# Altium schematic sheet Peripherals-Sheet-2.SchDoc
size 420 x 297 mm; SheetNumber: 10; SheetTotal: 12
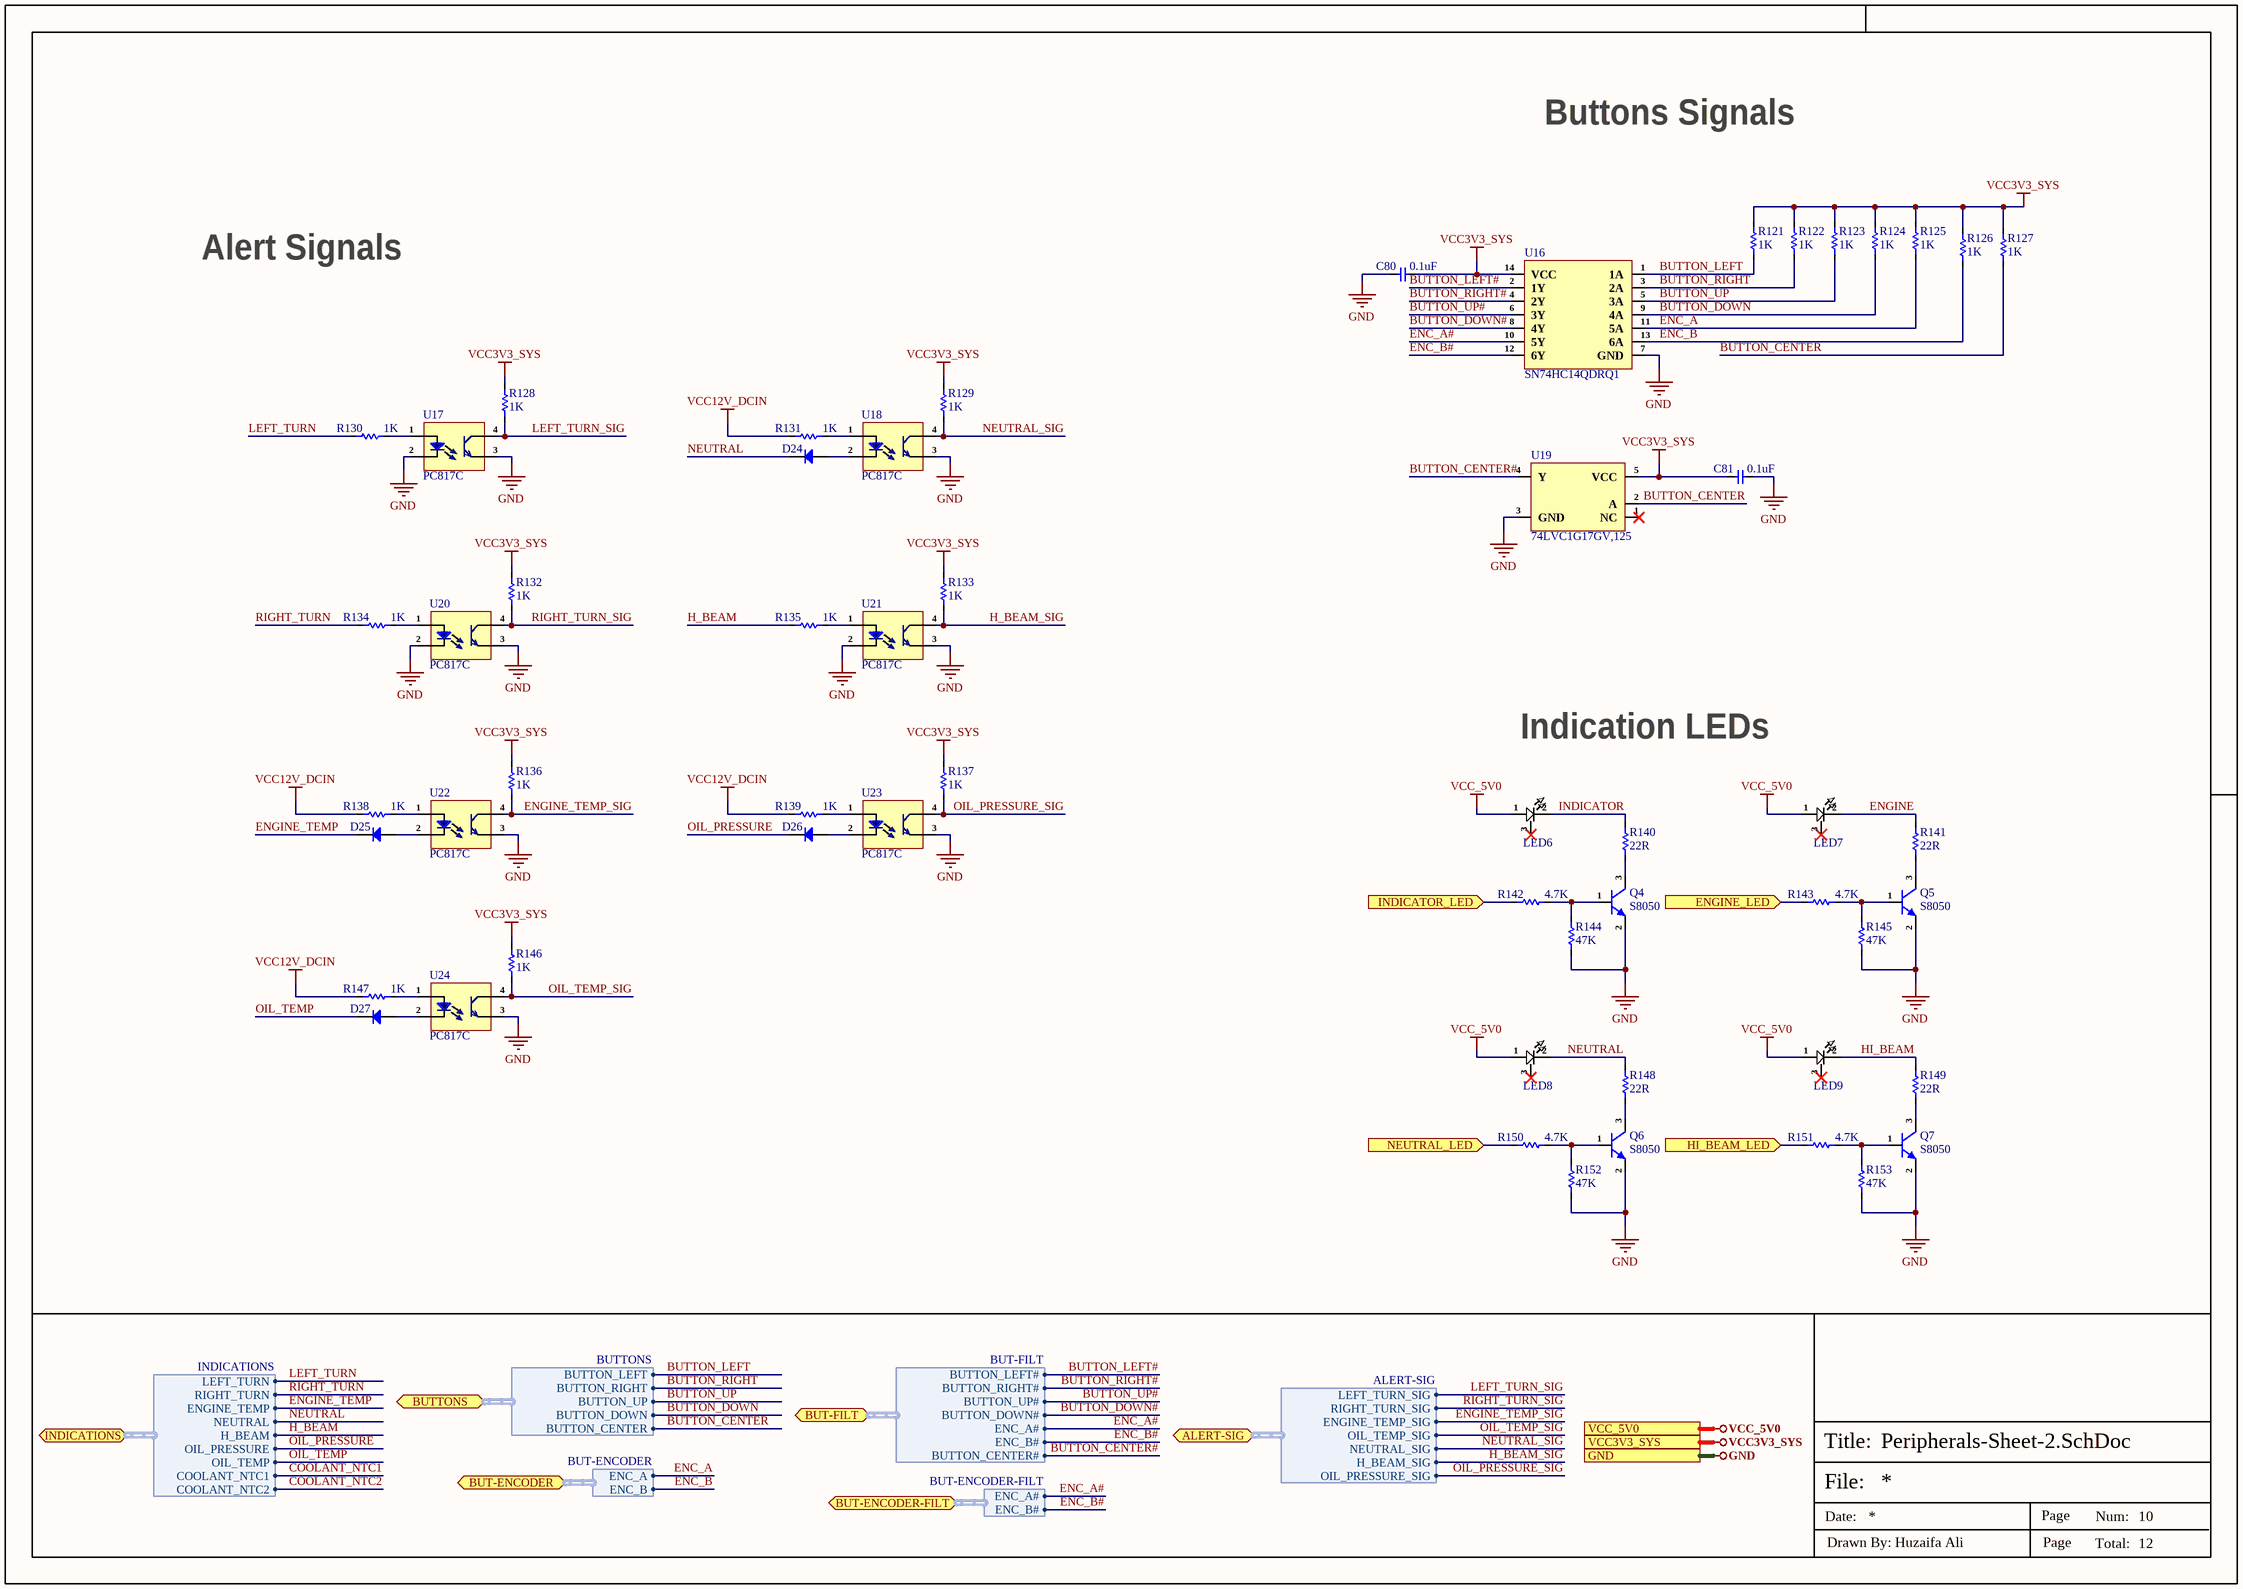
[diagram p0: Peripherals-Sheet-2.SchDoc]

## Parts
C80  0.1uF  [Cap-0402]
C81  0.1uF  [Cap-0402]
D24  1N4148W  [SOD-123]  (value not drawn)
D25  1N4148W  [SOD-123]  (value not drawn)
D26  1N4148W  [SOD-123]  (value not drawn)
D27  1N4148W  [SOD-123]  (value not drawn)
LED6  WHITE  (value not drawn)
LED7  WHITE  (value not drawn)
LED8  WHITE  (value not drawn)
LED9  WHITE  (value not drawn)
Q4  S8050  [SOT-23]
Q5  S8050  [SOT-23]
Q6  S8050  [SOT-23]
Q7  S8050  [SOT-23]
R121  1K  [Res-0402]
R122  1K  [Res-0402]
R123  1K  [Res-0402]
R124  1K  [Res-0402]
R125  1K  [Res-0402]
R126  1K  [Res-0402]
R127  1K  [Res-0402]
R128  1K  [Res-0402]
R129  1K  [Res-0402]
R130  1K  [Res-0402]
R131  1K  [Res-0402]
R132  1K  [Res-0402]
R133  1K  [Res-0402]
R134  1K  [Res-0402]
R135  1K  [Res-0402]
R136  1K  [Res-0402]
R137  1K  [Res-0402]
R138  1K  [Res-0402]
R139  1K  [Res-0402]
R140  22R
R141  22R
R142  4.7K  [Res-0402]
R143  4.7K  [Res-0402]
R144  47K  [Res-0402]
R145  47K  [Res-0402]
R146  1K  [Res-0402]
R147  1K  [Res-0402]
R148  22R
R149  22R
R150  4.7K  [Res-0402]
R151  4.7K  [Res-0402]
R152  47K  [Res-0402]
R153  47K  [Res-0402]
U16  SN74HC14QDRQ1  [SOIC-14]
U17  PC817C  [PC817C]
U18  PC817C  [PC817C]
U19  74LVC1G17GV,125  [SC-74A]
U20  PC817C  [PC817C]
U21  PC817C  [PC817C]
U22  PC817C  [PC817C]
U23  PC817C  [PC817C]
U24  PC817C  [PC817C]

## Ports
ALERT-SIG (bidir, harness ALERT-SIG, see Top-Sheet[4C]), BUT-ENCODER (bidir, harness BUT-ENCODER, see Top-Sheet[4C]), BUT-ENCODER-FILT (bidir, harness BUT-ENCODER-FILT), BUT-FILT (bidir, harness BUT-FILT, see Top-Sheet[4C]), BUTTONS (bidir, harness BUTTONS, see Top-Sheet[6C], Connector-Sheet[2D]), ENGINE_LED (in, see Top-Sheet[4C]), GND (see Top-Sheet[6C]), HI_BEAM_LED (in, see Top-Sheet[4C]), INDICATIONS (bidir, harness INDICATIONS, see Top-Sheet[6C], Connector-Sheet[1D], Peripherals-Sheet-1[3D]), INDICATOR_LED (in, see Top-Sheet[4C]), NEUTRAL_LED (in, see Top-Sheet[4C]), VCC3V3_SYS (see Top-Sheet[6C]), VCC_5V0 (see Top-Sheet[6C])

## Harnesses
INDICATIONS: LEFT_TURN, RIGHT_TURN, ENGINE_TEMP, NEUTRAL, H_BEAM, OIL_PRESSURE, OIL_TEMP, COOLANT_NTC1, COOLANT_NTC2
BUTTONS: BUTTON_LEFT, BUTTON_RIGHT, BUTTON_UP, BUTTON_DOWN, BUTTON_CENTER
BUT-ENCODER: ENC_A, ENC_B
BUT-FILT: BUTTON_LEFT#, BUTTON_RIGHT#, BUTTON_UP#, BUTTON_DOWN#, ENC_A#, ENC_B#, BUTTON_CENTER#
ALERT-SIG: LEFT_TURN_SIG, RIGHT_TURN_SIG, ENGINE_TEMP_SIG, OIL_TEMP_SIG, NEUTRAL_SIG, H_BEAM_SIG, OIL_PRESSURE_SIG
BUT-ENCODER-FILT: ENC_A#, ENC_B#

## Nets
GND: C80.2 C81.1 Q4.2(E) Q5.2(E) Q6.2(E) Q7.2(E) R144.1 R145.1 R152.1 R153.1 U16.7(GND) U17.2(Ca) U17.3(E) U18.3(E) U19.3(GND) U20.2(Ca) U20.3(E) U21.2(Ca) U21.3(E) U22.3(E) U23.3(E) U24.3(E) ; port GND
VCC3V3_SYS: C80.1 C81.2 R121.2 R122.2 R123.2 R124.2 R125.2 R126.2 R127.2 R128.2 R129.2 R132.2 R133.2 R136.2 R137.2 R146.2 U16.14(VCC) U19.5(VCC) ; port VCC3V3_SYS
VCC12V_DCIN: R131.1 R138.1 R139.1 R147.1
VCC_5V0: LED6.1 LED7.1 LED8.1 LED9.1 ; port VCC_5V0
BUTTON_CENTER: R127.1 U19.2(A) ; port BUTTONS.BUTTON_CENTER
BUTTON_CENTER#: U19.4(Y) ; port BUT-FILT.BUTTON_CENTER#
BUTTON_DOWN: R124.1 U16.9(4A) ; port BUTTONS.BUTTON_DOWN
BUTTON_DOWN#: U16.8(4Y) ; port BUT-FILT.BUTTON_DOWN#
BUTTON_LEFT: R121.1 U16.1(1A) ; port BUTTONS.BUTTON_LEFT
BUTTON_LEFT#: U16.2(1Y) ; port BUT-FILT.BUTTON_LEFT#
BUTTON_RIGHT: R122.1 U16.3(2A) ; port BUTTONS.BUTTON_RIGHT
BUTTON_RIGHT#: U16.4(2Y) ; port BUT-FILT.BUTTON_RIGHT#
BUTTON_UP: R123.1 U16.5(3A) ; port BUTTONS.BUTTON_UP
BUTTON_UP#: U16.6(3Y) ; port BUT-FILT.BUTTON_UP#
COOLANT_NTC1: port INDICATIONS.COOLANT_NTC1
COOLANT_NTC2: port INDICATIONS.COOLANT_NTC2
ENC_A: R125.1 U16.11(5A) ; port BUT-ENCODER.ENC_A
ENC_A#: U16.10(5Y) ; port BUT-FILT.ENC_A#, port BUT-ENCODER-FILT.ENC_A#
ENC_B: R126.1 U16.13(6A) ; port BUT-ENCODER.ENC_B
ENC_B#: U16.12(6Y) ; port BUT-FILT.ENC_B#, port BUT-ENCODER-FILT.ENC_B#
ENGINE: LED7.2 R141.2
ENGINE_LED: R143.1 ; port ENGINE_LED
ENGINE_TEMP: D25.2(K) ; port INDICATIONS.ENGINE_TEMP
ENGINE_TEMP_SIG: R136.1 U22.4(C) ; port ALERT-SIG.ENGINE_TEMP_SIG
H_BEAM: R135.1 ; port INDICATIONS.H_BEAM
H_BEAM_SIG: R133.1 U21.4(C) ; port ALERT-SIG.H_BEAM_SIG
HI_BEAM: LED9.2 R149.2
HI_BEAM_LED: R151.1 ; port HI_BEAM_LED
INDICATOR: LED6.2 R140.2
INDICATOR_LED: R142.1 ; port INDICATOR_LED
LEFT_TURN: R130.1 ; port INDICATIONS.LEFT_TURN
LEFT_TURN_SIG: R128.1 U17.4(C) ; port ALERT-SIG.LEFT_TURN_SIG
NEUTRAL: D24.2(K) LED8.2 R148.2 ; port INDICATIONS.NEUTRAL
NEUTRAL_LED: R150.1 ; port NEUTRAL_LED
NEUTRAL_SIG: R129.1 U18.4(C) ; port ALERT-SIG.NEUTRAL_SIG
OIL_PRESSURE: D26.2(K) ; port INDICATIONS.OIL_PRESSURE
OIL_PRESSURE_SIG: R137.1 U23.4(C) ; port ALERT-SIG.OIL_PRESSURE_SIG
OIL_TEMP: D27.2(K) ; port INDICATIONS.OIL_TEMP
OIL_TEMP_SIG: R146.1 U24.4(C) ; port ALERT-SIG.OIL_TEMP_SIG
RIGHT_TURN: R134.1 ; port INDICATIONS.RIGHT_TURN
RIGHT_TURN_SIG: R132.1 U20.4(C) ; port ALERT-SIG.RIGHT_TURN_SIG
NetD24_1: D24.1(A) U18.2(Ca)
NetD25_1: D25.1(A) U22.2(Ca)
NetD26_1: D26.1(A) U23.2(Ca)
NetD27_1: D27.1(A) U24.2(Ca)
NetQ4_1: Q4.1(B) R142.2 R144.2
NetQ4_3: Q4.3(C) R140.1
NetQ5_1: Q5.1(B) R143.2 R145.2
NetQ5_3: Q5.3(C) R141.1
NetQ6_1: Q6.1(B) R150.2 R152.2
NetQ6_3: Q6.3(C) R148.1
NetQ7_1: Q7.1(B) R151.2 R153.2
NetQ7_3: Q7.3(C) R149.1
NetR130_2: R130.2 U17.1(An)
NetR131_2: R131.2 U18.1(An)
NetR134_2: R134.2 U20.1(An)
NetR135_2: R135.2 U21.1(An)
NetR138_2: R138.2 U22.1(An)
NetR139_2: R139.2 U23.1(An)
NetR147_2: R147.2 U24.1(An)

Not connected (* = marked no-connect by the designer): LED6 3*; LED7 3*; LED8 3*; LED9 3*; U19 1(NC)*

## Notes on the sheet
- Buttons Signals
- Alert Signals
- Indication LEDs
- File:
- Title:
- Date:
- Page
- Num:
- Total:
- Drawn By: Huzaifa Ali

## Library data of the parts
C80 C81 = CC0402KRX5R6BB104: CAP CER 0.1UF 10V X5R 0402; Manufacturer: Yageo; Capacitance: 100nF; Tolerance: 10%; Dissipation Factor: 5%; Insulation Resistance: 10GR; Item Type: Capacitor; Supplier 1: Digi-Key; Manufacturer Part Number: CC0402KRX5R6BB104; RoHS: Yes; Category: Ceramic Capacitors; Stock 1: 6385580; Pricing 1: 1=0.10000, 10=0.02700, 50=0.01500, 100=0.01220, 500=0.00874, 1000=0.00687, 2500=0.00625, 5000=0.00575 (USD); Mount: Surface Mount; Case/Package: 0402; Number of Pins: 2; Case Code (Imperial): 0402; Case Code (Metric): 1005; Min Operating Temperature: -55°C; Max Operating Temperature: 85°C; Dielectric: X5R; Packaging: Tape and Reel; Voltage Rating: 10V; Package Quantity: 1; Termination: SMD/SMT; Voltage Rating (DC): 10V; Series: CC; Length: 1mm; Width: 0.02inch; Height: 0.5mm; Depth: 0.5mm; Thickness: 0.022inch; Radiation Hardening: No; RoHS Compliant: Yes; REACH SVHC: No SVHC; Lead Free: Lead Free; Halogen Free: Halogen Free; ComponentLink1URL: https://datasheet.ciiva.com/144/mlccorderingcode-144029.pdf?src-supplier=Digi-Key; ComponentLink1Description: https://datasheet.ciiva.com/144/mlccorderingcode-144029.pdf?src-supplier=Digi-Key; ComponentLink2URL: https://datasheet.ciiva.com/144/mlccorderingcode-144028.pdf?src-supplier=Digi-Key; ComponentLink2Description: https://datasheet.ciiva.com/144/mlccorderingcode-144028.pdf?src-supplier=Digi-Key; ComponentLink3URL: https://datasheet.ciiva.com/144/mlccorderingcode-144030.pdf?src-supplier=Digi-Key; ComponentLink3Description: https://datasheet.ciiva.com/144/mlccorderingcode-144030.pdf?src-supplier=Digi-Key; ComponentLink4URL: https://datasheet.ciiva.com/7978/1359354-7978091.pdf?src-supplier=Element14; ComponentLink4Description: https://datasheet.ciiva.com/7978/1359354-7978091.pdf?src-supplier=Element14; ComponentLink5URL: https://datasheet.ciiva.com/11587/upy-gphc-x5r-4v-to-50v-12-11587302.pdf?src-supplier=Avnet; ComponentLink5Description: https://datasheet.ciiva.com/11587/upy-gphc-x5r-4v-to-50v-12-11587302.pdf?src-supplier=Avnet; Supplier Part Number 1: 311-1336-1-ND; LCSC Part Number: C129131
D24-D27 = 1N4148W: 100V 400mW Single 1.25V@150mA 8ns 300mA SOD-123 Switching Diode ROHS; Manufacturer: JSMSEMI; ComponentLink1Description: LCSC; ComponentLink1URL: https://www.lcsc.com/product-detail/Switching-Diode_JSMSEMI-1N4148W_C917030.html; Manufacturer Part Number: 1N4148W; Package: SOD-123; LCSC Part Number: C917030; Item Type: Diode
LED6-LED9 = GW-CS8PM1.PM-LRLT-XX52-1-350-R18: White LED 350mA Cool 5700K 80° 1212
Q4-Q7 = S8050: Trans Gp Bjt NPN 25V 1.5A 300MW 3-PIN SOT-23 T/r; Manufacturer: Comchip; Manufacturer Part Number: SS8050-G; Collector Emitter Voltage (VCEO): 400mV; Transition Frequency: 100MHz; Item Type: Transistor; Supplier 1: Arrow Electronics; RoHS: Yes; Stock 1: 2514; Pricing 1: 1=0.26480, 10=0.19960, 25=0.19760, 50=0.19590, 100=0.09990, 250=0.09890, 500=0.07670, 1000=0.05180 (USD); Mount: Surface Mount; Case/Package: TO-236-3; Packaging: Tape and Reel; Max Power Dissipation: 300mW; Max Collector Current: 1.5A; Collector Emitter Breakdown Voltage: 25V; Max Breakdown Voltage: 25V; ComponentLink1URL: http://www.comchiptech.com/admin/files/product/SS8050-G RevA181526.pdf?src-supplier=Digi-Key; ComponentLink1Description: http://www.comchiptech.com/admin/files/product/SS8050-G RevA181526.pdf?src-supplier=Digi-Key; ComponentLink2URL: http://www.comchiptech.com/cms/UserFiles/SS8050-G%20RevA181526.pdf?src-supplier=Digi-Key; ComponentLink2Description: http://www.comchiptech.com/cms/UserFiles/SS8050-G%20RevA181526.pdf?src-supplier=Digi-Key; Supplier Part Number 1: SS8050-G; LCSC Part Number: C105433
R121-R139 R146 R147 = RC0402FR-071KL: RES 1K OHM 1% 1/16W 0402; Manufacturer: Yageo; Resistance: 1kR; Temperature Coefficient: 100ppm/°C; Voltage Rating (DC): 50V; Power Rating: 62.5mW; Max Power Dissipation: 63mW; Item Type: Resistor; Supplier 1: Avnet; Manufacturer Part Number: RC0402FR-071KL; RoHS: Yes; Category: Chip SMD Resistors; Stock 1: 13030000; Pricing 1: 10000=0.00085, 20000=0.00087, 40000=0.00084, 60000=0.00083, 80000=0.00079, 100000=0.00078, 1000000=0.00076 (USD); Case/Package: 0402; Number of Pins: 2; Case Code (Imperial): 0402; Case Code (Metric): 1005; Size Code: 0402; Min Operating Temperature: -55°C; Max Operating Temperature: 155°C; Resistor Type: Thick Film; Tolerance: 1%; Packaging: Tape and Reel; Voltage Rating: 50V; Termination: SMD/SMT; Features: Moisture Resistant; Series: RC; Number of Terminations: 2; Resistance Tolerance: 1%; Construction: Rectangular; Technology: THICK FILM; Length: 1mm; Width: 0.5mm; Height: 0.32mm; Depth: 0.5mm; Reach SVHC Compliant: Yes; Lead Free: Lead Free; RoHS Compliant: Yes; Military Standard: Not; ComponentLink1URL: https://datasheet.ciiva.com/11819/0900766b80c66297-11819477.pdf?src-supplier=RSComponents; ComponentLink1Description: https://datasheet.ciiva.com/11819/0900766b80c66297-11819477.pdf?src-supplier=RSComponents; ComponentLink2URL: https://datasheet.ciiva.com/7983/1018594-7983502.pdf?src-supplier=Element14; ComponentLink2Description: https://datasheet.ciiva.com/7983/1018594-7983502.pdf?src-supplier=Element14; ComponentLink3URL: https://datasheet.ciiva.com/22747/1018594-22747513.pdf?src-supplier=Element14; ComponentLink3Description: https://datasheet.ciiva.com/22747/1018594-22747513.pdf?src-supplier=Element14; ComponentLink4URL: https://datasheet.ciiva.com/12666/pyu-rc0402-51-rohs-l-6-r-12666741.pdf?src-supplier=Mouser; ComponentLink4Description: https://datasheet.ciiva.com/12666/pyu-rc0402-51-rohs-l-6-r-12666741.pdf?src-supplier=Mouser; ComponentLink5URL: https://datasheet.ciiva.com/7849/1018594-7849869.pdf?src-supplier=Element14; ComponentLink5Description: https://datasheet.ciiva.com/7849/1018594-7849869.pdf?src-supplier=Element14; ComponentLink6URL: https://datasheet.ciiva.com/7849/1018594-7849871.pdf?src-supplier=Element14; ComponentLink6Description: https://datasheet.ciiva.com/7849/1018594-7849871.pdf?src-supplier=Element14; ComponentLink7URL: https://datasheet.ciiva.com/17063/pyu-rc0402-51-rohs-l-6-r-17063193.pdf?src-supplier=Future+Electronics; ComponentLink7Description: https://datasheet.ciiva.com/17063/pyu-rc0402-51-rohs-l-6-r-17063193.pdf?src-supplier=Future+Electronics; Supplier Part Number 1: RC0402FR-071KL; LCSC Part Number: C106235
R140 R141 R148 R149 = RC2010FK-0722RL: RES 22 OHM 1% 750mW 2010
R142 R143 R150 R151 = RC0402FR-074K7L: RES 4.7K OHM 1% 1/16W 0402; Manufacturer: Yageo; Voltage Rating (DC): 50V; Power Rating: 62.5mW; Resistance: 4.7kR; Temperature Coefficient: 100ppm/°C; Max Power Dissipation: 63mW; Item Type: Resistor; Supplier 1: Avnet; Manufacturer Part Number: RC0402FR-074K7L; RoHS: Yes; Category: Chip SMD Resistors; Stock 1: 2420000; Pricing 1: 10000=0.00085 (USD); Case/Package: 0402; Number of Pins: 2; Case Code (Imperial): 0402; Case Code (Metric): 1005; Size Code: 0402; Min Operating Temperature: -55°C; Max Operating Temperature: 155°C; Tolerance: 1%; Voltage Rating: 50V; Packaging: Tape and Reel; Resistor Type: Thick Film; Termination: SMD/SMT; Features: Moisture Resistant; Series: RC; Number of Terminations: 2; Resistance Tolerance: 1%; Construction: Rectangular; Length: 1mm; Width: 0.5mm; Height: 0.32mm; Depth: 0.5mm; Height - Seated (Max): 0.016inch; RoHS Compliant: Yes; Reach SVHC Compliant: Yes; Military Standard: Not; Lead Free: Lead Free; ComponentLink1URL: https://datasheet.ciiva.com/22661/1686128-22661342.pdf?src-supplier=Element14; ComponentLink1Description: https://datasheet.ciiva.com/22661/1686128-22661342.pdf?src-supplier=Element14; ComponentLink2URL: https://datasheet.ciiva.com/7850/1018594-7850022.pdf?src-supplier=Element14; ComponentLink2Description: https://datasheet.ciiva.com/7850/1018594-7850022.pdf?src-supplier=Element14; ComponentLink3URL: https://datasheet.ciiva.com/7850/1018594-7850023.pdf?src-supplier=Element14; ComponentLink3Description: https://datasheet.ciiva.com/7850/1018594-7850023.pdf?src-supplier=Element14; ComponentLink4URL: https://datasheet.ciiva.com/15215/getdatasheetpartid-328119-15215035.pdf?src-supplier=Verical; ComponentLink4Description: https://datasheet.ciiva.com/15215/getdatasheetpartid-328119-15215035.pdf?src-supplier=Verical; Supplier Part Number 1: RC0402FR-074K7L; LCSC Part Number: C105871
R144 R145 R152 R153 = RC0402FR-0747KL: RES 47K OHM 1% 1/16W 0402; Manufacturer: Yageo; Power Rating: 62.5mW; Temperature Coefficient: 100ppm/°C; Voltage Rating: 50V; Resistance: 47kR; Max Power Dissipation: 63mW; Item Type: Resistor; Supplier 1: Avnet; Manufacturer Part Number: RC0402FR-0747KL; RoHS: Yes; Category: Chip SMD Resistors; Stock 1: 680000; Pricing 1: 10000=0.00085, 20000=0.00087, 40000=0.00084, 60000=0.00083, 80000=0.00079, 100000=0.00078, 1000000=0.00076 (USD); Case/Package: 0402; Case Code (Imperial): 0402; Case Code (Metric): 1005; Size Code: 0402; Min Operating Temperature: -55°C; Max Operating Temperature: 155°C; Tolerance: 1%; Series: RC; Packaging: Tape and Reel; Package Quantity: 1; Termination: SMD/SMT; Resistor Type: Thick Film; Number of Terminations: 2; Features: Moisture Resistant; Resistance Tolerance: 1%; Construction: Rectangular; Length: 1mm; Width: 0.02inch; Height: 0.016inch; Depth: 0.5mm; RoHS Compliant: Yes; Military Standard: Not; Lead Free: Lead Free; ComponentLink1URL: https://datasheet.ciiva.com/46412/1018594-46412839.pdf?src-supplier=Element14; ComponentLink1Description: https://datasheet.ciiva.com/46412/1018594-46412839.pdf?src-supplier=Element14; ComponentLink2URL: https://datasheet.ciiva.com/2453/pyu-r-int-thick-7-2453389.pdf?src-supplier=Digi-Key; ComponentLink2Description: https://datasheet.ciiva.com/2453/pyu-r-int-thick-7-2453389.pdf?src-supplier=Digi-Key; ComponentLink3URL: https://datasheet.ciiva.com/2453/pyu-r-int-thick-7-2453390.pdf?src-supplier=Digi-Key; ComponentLink3Description: https://datasheet.ciiva.com/2453/pyu-r-int-thick-7-2453390.pdf?src-supplier=Digi-Key; ComponentLink4URL: https://datasheet.ciiva.com/2453/pyu-r-int-thick-7-2453388.pdf?src-supplier=Digi-Key; ComponentLink4Description: https://datasheet.ciiva.com/2453/pyu-r-int-thick-7-2453388.pdf?src-supplier=Digi-Key; ComponentLink5URL: https://datasheet.ciiva.com/15189/getdatasheetpartid-323748-15189466.pdf?src-supplier=Verical; ComponentLink5Description: https://datasheet.ciiva.com/15189/getdatasheetpartid-323748-15189466.pdf?src-supplier=Verical; ComponentLink6URL: https://datasheet.ciiva.com/16793/pyu-rc0402-51-rohs-l-6-r-16793430.pdf?src-supplier=Future+Electronics; ComponentLink6Description: https://datasheet.ciiva.com/16793/pyu-rc0402-51-rohs-l-6-r-16793430.pdf?src-supplier=Future+Electronics; Supplier Part Number 1: RC0402FR-0747KL; LCSC Part Number: C93943
U16 = SN74HC14QDRQ1: IC INVERT SCHMITT 6CH 1IN 14SOIC; Manufacturer: Texas Instruments; Max Supply Voltage: 6V; Min Supply Voltage: 2V; Operating Supply Voltage: 5V; Propagation Delay: 21ns; Logic Function: Buffer,Inverter,Schmitt Trigger; Number of Elements: 6; Output Current: 25mA; Low Level Output Current: 5.2mA; Quiescent Current: 2uA; High Level Output Current: -5.2mA; Schmitt Trigger Input: Yes; Input Type: SCHMITT TRIGGER; Supplier: Mouser; Supplier Part Number: 595-SN74HC14QDRQ1; Manufacturer Part Number: SN74HC14QDRQ1; RoHS: Yes; Category: Logic Gates; Stock: 6966; Pricing: 1=0.68, 10=0.601, 50=0.601, 100=0.503, 1000=0.392, 10000=0.3 (USD); Mounting Technology: Surface Mount; Case/Package: SOIC; Pins: 14; Weight: 0.004318oz; Min Operating Temperature: -40°C; Max Operating Temperature: 125°C; Packaging: Tape and Reel; Package Quantity: 1; Number of Inputs: 6; Number of Circuits: 6; Turn-On Delay Time: 21ns; Number of Gates: 6; Number of Bits: 6; Series: 74HC; Technology: CMOS; Length: 8.65mm; Width: 3.91mm; Height: 1.58mm; Radiation Hardening: No; Reach SVHC Compliant: No; Lead Free: Lead Free; RoHS Compliant: Yes; ComponentLink1URL: https://datasheet.ciiva.com/15089/getdatasheetpartid-126971-15089251.pdf?src-supplier=Verical; ComponentLink1Description: https://datasheet.ciiva.com/15089/getdatasheetpartid-126971-15089251.pdf?src-supplier=Verical; ComponentLink2URL: https://datasheet.ciiva.com/1864/sn74hc14-q1-1864939.pdf?src-supplier=Digikey; ComponentLink2Description: https://datasheet.ciiva.com/1864/sn74hc14-q1-1864939.pdf?src-supplier=Digikey; ComponentLink3URL: https://datasheet.ciiva.com/1864/sn74hc14-q1-1864938.pdf?src-supplier=Digikey; ComponentLink3Description: https://datasheet.ciiva.com/1864/sn74hc14-q1-1864938.pdf?src-supplier=Digikey; ComponentLink4URL: https://datasheet.ciiva.com/1864/sn74hc14-q1-1864940.pdf?src-supplier=Digikey; ComponentLink4Description: https://datasheet.ciiva.com/1864/sn74hc14-q1-1864940.pdf?src-supplier=Digikey; ComponentLink5URL: https://datasheet.ciiva.com/14288/sn74hc14-q1-14288654.pdf?src-supplier=Avnet; ComponentLink5Description: https://datasheet.ciiva.com/14288/sn74hc14-q1-14288654.pdf?src-supplier=Avnet; ComponentLink6URL: https://datasheet.ciiva.com/48703/001073384-da-01-en-ic-hex-schmitt-sn74hc14qdrq1-soic-14-tid-48703180.pdf?src-supplier=Conrad; ComponentLink6Description: https://datasheet.ciiva.com/48703/001073384-da-01-en-ic-hex-schmitt-sn74hc14qdrq1-soic-14-tid-48703180.pdf?src-supplier=Conrad; LCSC Part Number: C507235; Item Type: IC
U17 U18 U20-U24 = PC817C: 70V 5kV 50mA 100mV@1mA,20mA 1 6V 1.2V DC SMD-4 Transistor Output Optocoupler ROHS; Manufacturer: Slkor; Item Type: IC; Manufacturer Part Number: PC817C; Package: SMD-4; LCSC Part Number: C2936043; ComponentLink1Description: LCSC; ComponentLink1URL: https://www.lcsc.com/product-detail/Transistor-Output-Optocoupler_Slkor-SLKORMICRO-Elec-PC817C_C2936043.html
U19 = 74LVC1G17GV,125: IC BUFFER SCHMITT TRIGGER 5TSOP; Manufacturer: Nexperia; Number of Channels: 1NUMBER; Supplier: Future Electronics; Supplier Part Number: 9876707; Manufacturer Part Number: 74LVC1G17GV,125; RoHS: Yes; Category: Logic Gates; Stock: 513000; Pricing: 3000=0.0334, 9000=0.0322, 30000=0.031, 60000=0.0303, 120000=0.029 (USD); Pins: 5NUMBER; Packaging: 10Packaging; RoHS Compliant: Yes; ComponentLink1URL: http://www.farnell.com/datasheets/2185283.pdf?src-supplier=Farnell; ComponentLink1Description: http://www.farnell.com/datasheets/2185283.pdf?src-supplier=Farnell; ComponentLink2URL: https://datasheet.octopart.com/74LVC1G17GV%2C125-Nexperia-datasheet-11799833.pdf?src-supplier=Farnell; ComponentLink2Description: https://datasheet.octopart.com/74LVC1G17GV%2C125-Nexperia-datasheet-11799833.pdf?src-supplier=Farnell; ComponentLink3URL: https://assets.nexperia.com/documents/data-sheet/74LVC1G17.pdf?src-supplier=Digikey; ComponentLink3Description: https://assets.nexperia.com/documents/data-sheet/74LVC1G17.pdf?src-supplier=Digikey; ComponentLink4URL: https://datasheet.octopart.com/74LVC1G17GV%2C125-Nexperia-datasheet-116120530.pdf?src-supplier=Future+Electronics; ComponentLink4Description: https://datasheet.octopart.com/74LVC1G17GV%2C125-Nexperia-datasheet-116120530.pdf?src-supplier=Future+Electronics; ComponentLink5URL: https://datasheet.octopart.com/74LVC1G17GV%2C125-Nexperia-datasheet-73818103.pdf?src-supplier=Element14; ComponentLink5Description: https://datasheet.octopart.com/74LVC1G17GV%2C125-Nexperia-datasheet-73818103.pdf?src-supplier=Element14; ComponentLink6URL: https://datasheet.octopart.com/74LVC1G17GV%2C125-NXP-Semiconductors-datasheet-13026859.pdf?src-supplier=Newark; ComponentLink6Description: https://datasheet.octopart.com/74LVC1G17GV%2C125-NXP-Semiconductors-datasheet-13026859.pdf?src-supplier=Newark; LCSC Part Number: C6076; Item Type: IC